# Altium schematic sheet kishan_padum_discharge.SchDoc
size A4; SheetNumber: 1; SheetTotal: 1
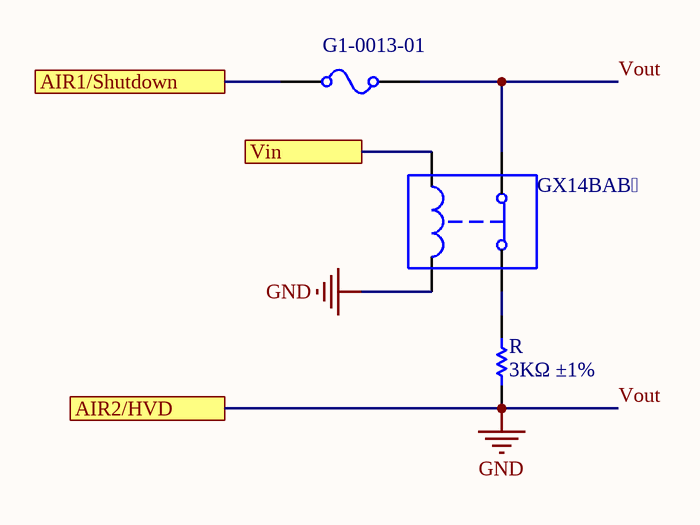
[diagram p0: kishan_padum_discharge.SchDoc]

## Parts
G1-0013-01  Fuse  (value not drawn)
GX14BAB  Single-Pole, Single-Throw Normally Closed Relay  (value not drawn)
R  value 3KΩ ±1%  (hidden comment: Resistor)

## Ports
AIR1/Shutdown, AIR2/HVD, Vin

## Nets
Vout: G1-0013-01.2 GX14BAB.1 GX14BAB.4 R.1 ; port AIR2/HVD  [also labelled GND]
AIR1/Shutdown: G1-0013-01.1 ; port AIR1/Shutdown
Vin: GX14BAB.3 ; port Vin
NetGX14BAB_2: GX14BAB.2 R.2

## Library data of the parts
G1-0013-01 = Fuse: RESISTANCE: 1m; SimulationGenericComponent: True
GX14BAB = SPST Relay NC: L_C: 1u; R_C: 100; RON: 1; ROFF: 1e12; ION: 1m; IOFF: 0; SimulationGenericComponent: True
R = Resistor: TC1: 0; SimulationGenericComponent: True; TC2: 0